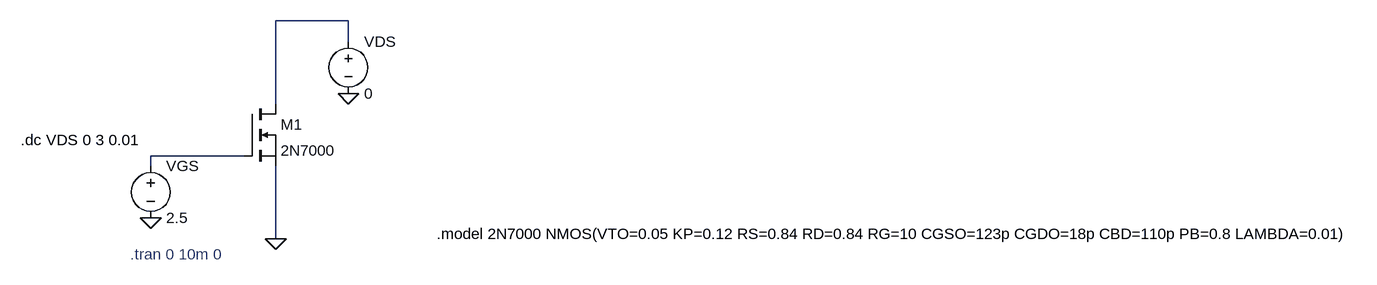
[diagram p0: schematic mosfet.asc]
mosfet.asc, the LTspice schematic file:
Version 4
SHEET 1 1856 680
WIRE 240 -128 128 -128
WIRE 240 -96 240 -128
WIRE 128 0 128 -128
WIRE 80 80 -64 80
WIRE -64 96 -64 80
WIRE 128 208 128 96
FLAG 240 -16 0
FLAG -64 176 0
FLAG 128 208 0
SYMBOL nmos 80 0 R0
SYMATTR InstName M1
SYMATTR Value 2N7000
SYMBOL voltage -64 80 R0
SYMATTR InstName VGS
SYMATTR Value 2.5
SYMBOL voltage 240 -112 R0
SYMATTR InstName VDS
SYMATTR Value 0
TEXT 376 200 Left 2 !.model 2N7000 NMOS(VTO=0.05 KP=0.12 RS=0.84 RD=0.84 RG=10 CGSO=123p CGDO=18p CBD=110p PB=0.8 LAMBDA=0.01)
TEXT -96 232 Left 2 ;.tran 0 10m 0
TEXT -264 56 Left 2 !.dc VDS 0 3 0.01

The netlist it stands for:
* mosfet.asc
M1 N001 N002 0 0 2N7000
VGS N002 0 2.5
VDS N001 0 0
.model NMOS NMOS
.model PMOS PMOS
.lib standard.mos
.model 2N7000 NMOS(VTO=0.05 KP=0.12 RS=0.84 RD=0.84 RG=10 CGSO=123p CGDO=18p CBD=110p PB=0.8 LAMBDA=0.01)
* .tran 0 10m 0
.dc VDS 0 3 0.01
.backanno
.end